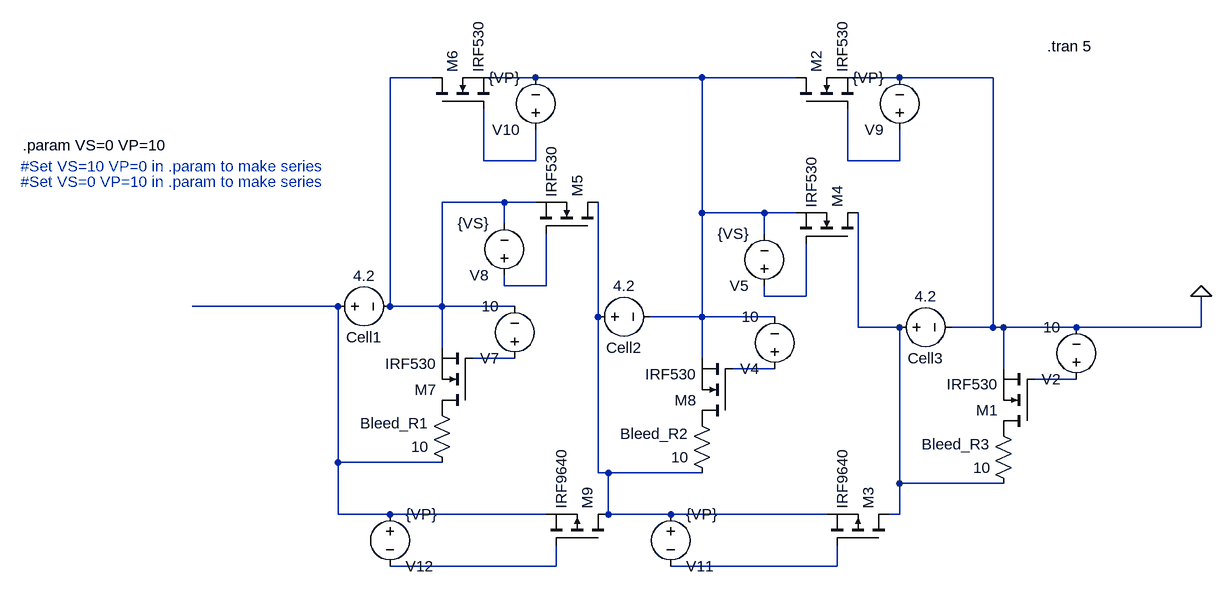
[diagram p0: schematic Switch_circuit.asc]
Switch_circuit.asc, the LTspice schematic file:
Version 4.1
SHEET 1 1204 736
WIRE 0 -256 -64 -256
WIRE 160 -256 96 -256
WIRE 416 -256 160 -256
WIRE 560 -256 416 -256
WIRE 720 -256 656 -256
WIRE 864 -256 720 -256
WIRE 80 -128 80 -208
WIRE 160 -128 160 -176
WIRE 160 -128 80 -128
WIRE 640 -128 640 -208
WIRE 720 -128 720 -176
WIRE 720 -128 640 -128
WIRE 112 -64 16 -64
WIRE 160 -64 112 -64
WIRE 416 -48 416 -256
WIRE 512 -48 416 -48
WIRE 560 -48 512 -48
WIRE 112 -32 112 -64
WIRE 512 -16 512 -48
WIRE 112 64 112 48
WIRE 176 64 176 -16
WIRE 176 64 112 64
WIRE 512 80 512 64
WIRE 576 80 576 0
WIRE 576 80 512 80
WIRE -144 96 -368 96
WIRE -64 96 -64 -256
WIRE 16 96 16 -64
WIRE 16 96 -64 96
WIRE 128 96 16 96
WIRE 256 112 256 -64
WIRE 416 112 416 -48
WIRE 416 112 336 112
WIRE 528 112 416 112
WIRE 656 128 656 -48
WIRE 720 128 656 128
WIRE 864 128 864 -256
WIRE 864 128 800 128
WIRE 880 128 864 128
WIRE 992 128 880 128
WIRE 1184 128 1184 80
WIRE 1184 128 992 128
WIRE 16 160 16 96
WIRE 128 176 64 176
WIRE 416 176 416 112
WIRE 528 192 464 192
WIRE 880 192 880 128
WIRE 992 208 928 208
WIRE -144 336 -144 96
WIRE 16 336 -144 336
WIRE 256 352 256 112
WIRE 272 352 256 352
WIRE 416 352 272 352
WIRE 720 368 720 128
WIRE 880 368 720 368
WIRE -144 416 -144 336
WIRE -64 416 -144 416
WIRE 176 416 -64 416
WIRE 272 416 272 352
WIRE 368 416 272 416
WIRE 608 416 368 416
WIRE 720 416 720 368
WIRE 720 416 704 416
WIRE 192 496 192 464
WIRE 192 496 -64 496
WIRE 624 496 624 464
WIRE 624 496 368 496
FLAG 1184 80 0
SYMBOL nmos 928 288 R180
SYMATTR InstName M1
SYMATTR Value IRF530
SYMBOL res 896 384 R180
WINDOW 0 36 76 Left 2
WINDOW 3 36 40 Left 2
SYMATTR InstName Bleed_R3
SYMATTR Value 10
SYMBOL voltage 704 128 R270
WINDOW 0 -32 56 VBottom 2
WINDOW 3 32 56 VTop 2
WINDOW 123 0 0 Left 0
WINDOW 39 0 0 Left 0
SYMATTR InstName Cell3
SYMATTR Value 4.2
SYMBOL voltage 992 224 R180
WINDOW 123 0 0 Left 0
WINDOW 39 0 0 Left 0
SYMATTR InstName V2
SYMATTR Value 10
SYMBOL res 432 368 R180
WINDOW 0 36 76 Left 2
WINDOW 3 36 40 Left 2
SYMATTR InstName Bleed_R2
SYMATTR Value 10
SYMBOL voltage 240 112 R270
WINDOW 0 -32 56 VBottom 2
WINDOW 3 32 56 VTop 2
WINDOW 123 0 0 Left 0
WINDOW 39 0 0 Left 0
SYMATTR InstName Cell2
SYMATTR Value 4.2
SYMBOL voltage 528 208 R180
WINDOW 123 0 0 Left 0
WINDOW 39 0 0 Left 0
SYMATTR InstName V4
SYMATTR Value 10
SYMBOL voltage 512 80 R180
WINDOW 123 0 0 Left 0
WINDOW 39 0 0 Left 0
SYMATTR InstName V5
SYMATTR Value {VS}
SYMBOL res 32 352 R180
WINDOW 0 36 76 Left 2
WINDOW 3 36 40 Left 2
SYMATTR InstName Bleed_R1
SYMATTR Value 10
SYMBOL voltage -160 96 R270
WINDOW 0 -32 56 VBottom 2
WINDOW 3 32 56 VTop 2
WINDOW 123 0 0 Left 0
WINDOW 39 0 0 Left 0
SYMATTR InstName Cell1
SYMATTR Value 4.2
SYMBOL voltage 128 192 R180
WINDOW 123 0 0 Left 0
WINDOW 39 0 0 Left 0
SYMATTR InstName V7
SYMATTR Value 10
SYMBOL voltage 112 64 R180
WINDOW 123 0 0 Left 0
WINDOW 39 0 0 Left 0
SYMATTR InstName V8
SYMATTR Value {VS}
SYMBOL nmos 560 -208 R270
SYMATTR InstName M2
SYMATTR Value IRF530
SYMBOL voltage 720 -160 R180
WINDOW 123 0 0 Left 0
WINDOW 39 0 0 Left 0
SYMATTR InstName V9
SYMATTR Value {VP}
SYMBOL voltage 160 -160 R180
WINDOW 123 0 0 Left 0
WINDOW 39 0 0 Left 0
SYMATTR InstName V10
SYMATTR Value {VP}
SYMBOL lib\\sym\\pmos 704 464 M270
SYMATTR InstName M3
SYMATTR Value IRF9640
SYMBOL voltage 368 400 R0
WINDOW 0 24 96 Left 2
WINDOW 3 24 16 Left 2
WINDOW 123 0 0 Left 0
WINDOW 39 0 0 Left 0
SYMATTR InstName V11
SYMATTR Value {VP}
SYMBOL voltage -64 400 R0
WINDOW 0 24 96 Left 2
WINDOW 3 24 16 Left 2
WINDOW 123 0 0 Left 0
WINDOW 39 0 0 Left 0
SYMATTR InstName V12
SYMATTR Value {VP}
SYMBOL nmos 656 0 M270
SYMATTR InstName M4
SYMATTR Value IRF530
SYMBOL nmos 256 -16 M270
SYMATTR InstName M5
SYMATTR Value IRF530
SYMBOL nmos 0 -208 R270
SYMATTR InstName M6
SYMATTR Value IRF530
SYMBOL nmos 64 256 R180
SYMATTR InstName M7
SYMATTR Value IRF530
SYMBOL nmos 464 272 R180
SYMATTR InstName M8
SYMATTR Value IRF530
SYMBOL lib\\sym\\pmos 272 464 M270
SYMATTR InstName M9
SYMATTR Value IRF9640
TEXT 1016 -304 Right 2 !.tran 5
TEXT -408 -152 Right 2 !.param VS=0 VP=10
TEXT -632 -120 Left 2 ;#Set VS=10 VP=0 in .param to make series
TEXT -632 -96 Left 2 ;#Set VS=0 VP=10 in .param to make series

The netlist it stands for:
* Switch_circuit.asc
M1 P001 N012 0 0 IRF530
R§Bleed_R3 N009 P001 10
V§Cell3 N009 0 4.2
V2 N012 0 10
R§Bleed_R2 N008 P002 10
V§Cell2 N008 N002 4.2
V4 N011 N002 10
V5 N006 N002 {VS}
R§Bleed_R1 N007 P003 10
V§Cell1 N007 N001 4.2
V7 N010 N001 10
V8 N005 N001 {VS}
M2 N002 N004 0 0 IRF530
V9 N004 0 {VP}
V10 N003 N002 {VP}
M3 N009 N014 N008 N008 IRF9640
V11 N008 N014 {VP}
V12 N007 N013 {VP}
M4 N009 N006 N002 N002 IRF530
M5 N008 N005 N001 N001 IRF530
M6 N001 N003 N002 N002 IRF530
M7 P003 N010 N001 N001 IRF530
M8 P002 N011 N002 N002 IRF530
M9 N008 N013 N007 N007 IRF9640
.model NMOS NMOS
.model PMOS PMOS
.lib standard.mos
.tran 5
.param VS=0 VP=10
* #Set VS=10 VP=0 in .param to make series
* #Set VS=0 VP=10 in .param to make series
.backanno
.end